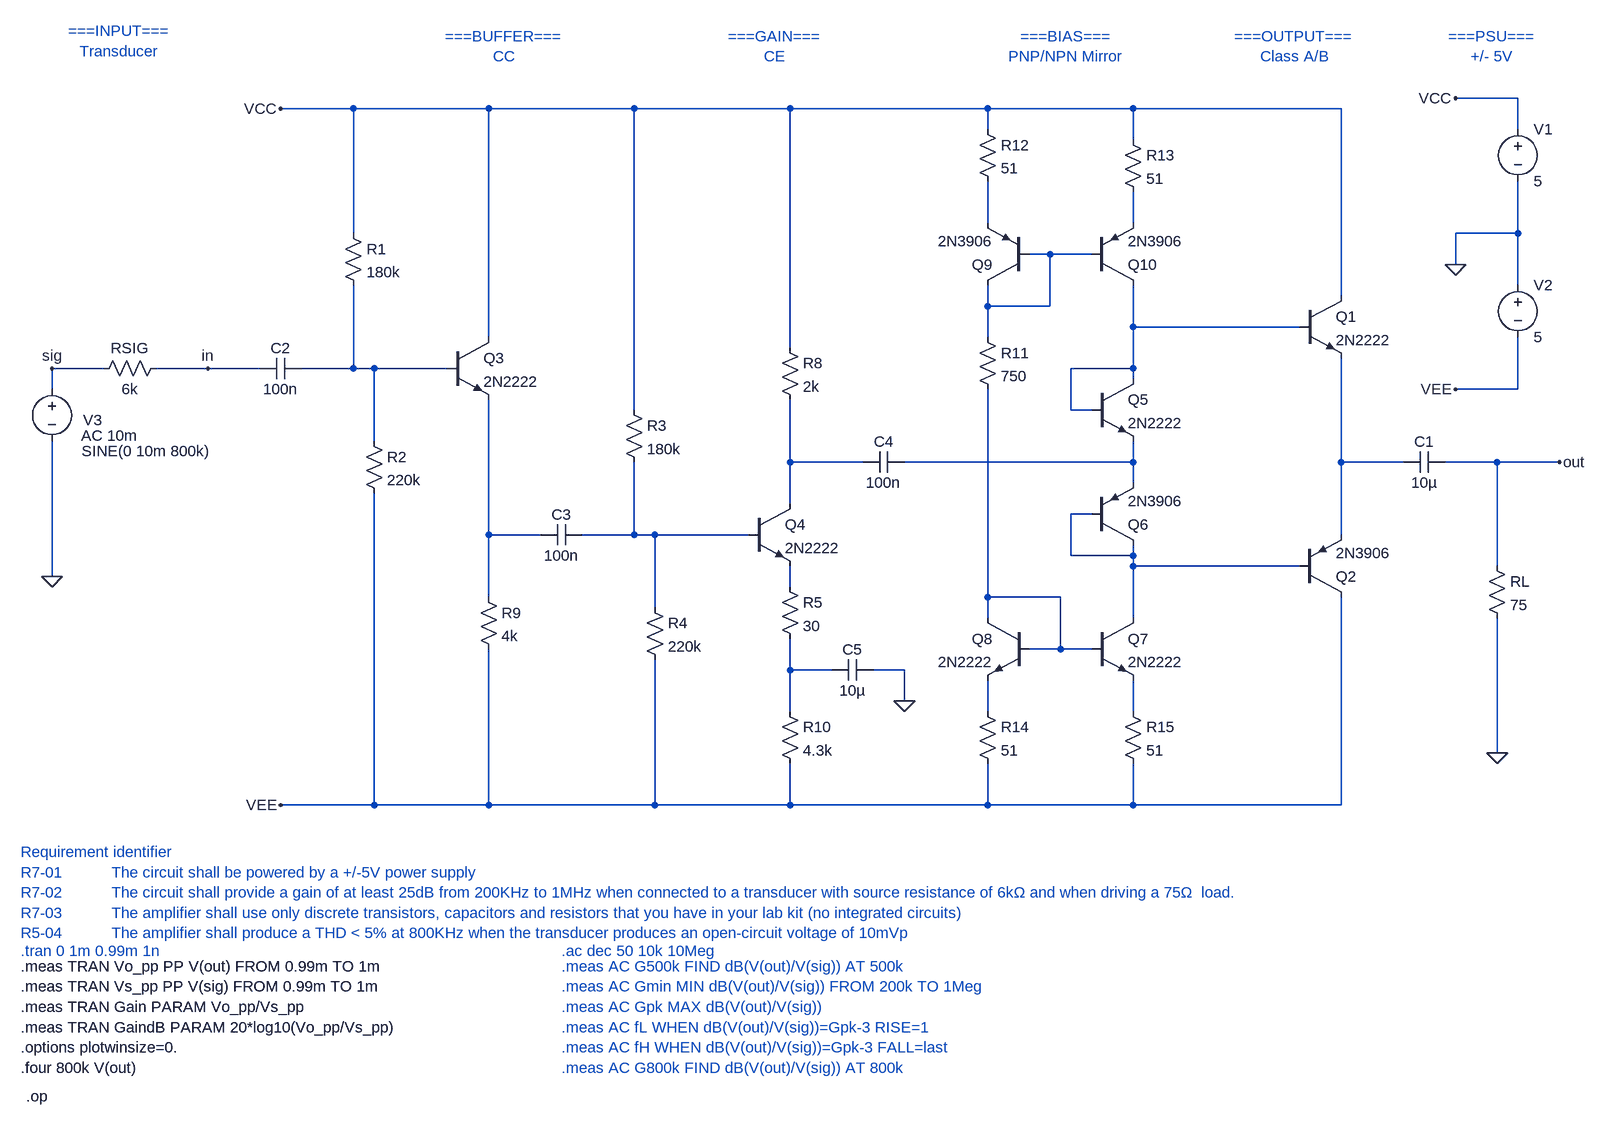
[diagram p0: schematic Lab 7 Amplifer V2.asc]
Lab 7 Amplifer V2.asc, the LTspice schematic file:
Version 4.1
SHEET 1 2900 1576
WIRE 2560 -752 2464 -752
WIRE 768 -736 656 -736
WIRE 976 -736 768 -736
WIRE 1200 -736 976 -736
WIRE 1440 -736 1200 -736
WIRE 1744 -736 1440 -736
WIRE 1968 -736 1744 -736
WIRE 2288 -736 1968 -736
WIRE 1744 -704 1744 -736
WIRE 2560 -704 2560 -752
WIRE 1968 -688 1968 -736
WIRE 1744 -560 1744 -624
WIRE 1968 -560 1968 -608
WIRE 768 -544 768 -736
WIRE 2560 -544 2560 -624
WIRE 2560 -544 2464 -544
WIRE 1840 -512 1808 -512
WIRE 1904 -512 1840 -512
WIRE 2464 -496 2464 -544
WIRE 2560 -464 2560 -544
WIRE 2288 -448 2288 -736
WIRE 1744 -432 1744 -464
WIRE 1840 -432 1840 -512
WIRE 1840 -432 1744 -432
WIRE 1968 -400 1968 -464
WIRE 2224 -400 1968 -400
WIRE 976 -384 976 -736
WIRE 1744 -384 1744 -432
WIRE 1440 -368 1440 -736
WIRE 384 -336 304 -336
WIRE 544 -336 464 -336
WIRE 624 -336 544 -336
WIRE 768 -336 768 -464
WIRE 768 -336 688 -336
WIRE 800 -336 768 -336
WIRE 912 -336 800 -336
WIRE 1968 -336 1968 -400
WIRE 1968 -336 1872 -336
WIRE 1968 -320 1968 -336
WIRE 304 -304 304 -336
WIRE 2560 -304 2560 -384
WIRE 2560 -304 2464 -304
WIRE 1200 -272 1200 -736
WIRE 1872 -272 1872 -336
WIRE 1904 -272 1872 -272
WIRE 800 -224 800 -336
WIRE 1440 -192 1440 -288
WIRE 1552 -192 1440 -192
WIRE 1968 -192 1968 -224
WIRE 1968 -192 1616 -192
WIRE 2288 -192 2288 -352
WIRE 2384 -192 2288 -192
WIRE 2528 -192 2448 -192
WIRE 2624 -192 2528 -192
WIRE 1968 -160 1968 -192
WIRE 1440 -128 1440 -192
WIRE 1904 -112 1872 -112
WIRE 976 -80 976 -288
WIRE 1056 -80 976 -80
WIRE 1200 -80 1200 -192
WIRE 1200 -80 1120 -80
WIRE 1232 -80 1200 -80
WIRE 1376 -80 1232 -80
WIRE 2288 -80 2288 -192
WIRE 1872 -48 1872 -112
WIRE 1968 -48 1968 -64
WIRE 1968 -48 1872 -48
WIRE 1968 -32 1968 -48
WIRE 2224 -32 1968 -32
WIRE 2528 -32 2528 -192
WIRE 304 -16 304 -224
WIRE 1440 0 1440 -32
WIRE 976 16 976 -80
WIRE 1744 16 1744 -304
WIRE 1856 16 1744 16
WIRE 1232 32 1232 -80
WIRE 1744 48 1744 16
WIRE 1968 48 1968 -32
WIRE 1856 96 1856 16
WIRE 1856 96 1808 96
WIRE 1904 96 1856 96
WIRE 1440 128 1440 80
WIRE 1504 128 1440 128
WIRE 1616 128 1568 128
WIRE 1616 176 1616 128
WIRE 1440 192 1440 128
WIRE 1744 192 1744 144
WIRE 1968 192 1968 144
WIRE 2528 256 2528 48
WIRE 800 336 800 -144
WIRE 800 336 656 336
WIRE 976 336 976 96
WIRE 976 336 800 336
WIRE 1232 336 1232 112
WIRE 1232 336 976 336
WIRE 1440 336 1440 272
WIRE 1440 336 1232 336
WIRE 1744 336 1744 272
WIRE 1744 336 1440 336
WIRE 1968 336 1968 272
WIRE 1968 336 1744 336
WIRE 2288 336 2288 16
WIRE 2288 336 1968 336
FLAG 2464 -496 0
FLAG 2464 -304 VEE
FLAG 2464 -752 VCC
FLAG 304 -16 0
FLAG 304 -336 sig
FLAG 544 -336 in
FLAG 2528 256 0
FLAG 2624 -192 out
FLAG 656 336 VEE
FLAG 656 -736 VCC
FLAG 1616 176 0
SYMBOL voltage 2560 -720 R0
WINDOW 123 0 0 Left 0
WINDOW 39 0 0 Left 0
SYMATTR InstName V1
SYMATTR Value 5
SYMBOL voltage 2560 -480 R0
WINDOW 123 0 0 Left 0
WINDOW 39 0 0 Left 0
SYMATTR InstName V2
SYMATTR Value 5
SYMBOL voltage 304 -320 R0
WINDOW 0 48 63 Left 2
WINDOW 3 46 111 Left 2
WINDOW 123 45 87 Left 2
WINDOW 39 0 0 Left 0
SYMATTR InstName V3
SYMATTR Value SINE(0 10m 800k)
SYMATTR Value2 AC 10m
SYMBOL res 480 -352 R90
WINDOW 0 0 56 VBottom 2
WINDOW 3 32 56 VTop 2
SYMATTR InstName RSIG
SYMATTR Value 6k
SYMBOL res 2512 -48 R0
SYMATTR InstName RL
SYMATTR Value 75
SYMBOL npn 2224 -448 R0
SYMATTR InstName Q1
SYMATTR Value 2N2222
SYMBOL pnp 2224 16 M180
SYMATTR InstName Q2
SYMATTR Value 2N3906
SYMBOL cap 2448 -208 R90
WINDOW 0 0 32 VBottom 2
WINDOW 3 32 32 VTop 2
SYMATTR InstName C1
SYMATTR Value 10µ
SYMBOL cap 688 -352 R90
WINDOW 0 0 32 VBottom 2
WINDOW 3 32 32 VTop 2
SYMATTR InstName C2
SYMATTR Value 100n
SYMBOL npn 912 -384 R0
SYMATTR InstName Q3
SYMATTR Value 2N2222
SYMBOL res 752 -560 R0
SYMATTR InstName R1
SYMATTR Value 180k
SYMBOL res 784 -240 R0
SYMATTR InstName R2
SYMATTR Value 220k
SYMBOL npn 1376 -128 R0
SYMATTR InstName Q4
SYMATTR Value 2N2222
SYMBOL cap 1120 -96 R90
WINDOW 0 0 32 VBottom 2
WINDOW 3 32 32 VTop 2
SYMATTR InstName C3
SYMATTR Value 100n
SYMBOL res 1184 -288 R0
SYMATTR InstName R3
SYMATTR Value 180k
SYMBOL res 1216 16 R0
SYMATTR InstName R4
SYMATTR Value 220k
SYMBOL cap 1616 -208 R90
WINDOW 0 0 32 VBottom 2
WINDOW 3 32 32 VTop 2
SYMATTR InstName C4
SYMATTR Value 100n
SYMBOL res 1424 -16 R0
SYMATTR InstName R5
SYMATTR Value 30
SYMBOL res 1424 -384 R0
SYMATTR InstName R8
SYMATTR Value 2k
SYMBOL res 960 0 R0
SYMATTR InstName R9
SYMATTR Value 4k
SYMBOL res 1424 176 R0
SYMATTR InstName R10
SYMATTR Value 4.3k
SYMBOL cap 1568 112 R90
WINDOW 0 0 32 VBottom 2
WINDOW 3 32 32 VTop 2
SYMATTR InstName C5
SYMATTR Value 10µ
SYMBOL npn 1904 -320 R0
SYMATTR InstName Q5
SYMATTR Value 2N2222
SYMBOL pnp 1904 -64 M180
SYMATTR InstName Q6
SYMATTR Value 2N3906
SYMBOL npn 1904 48 R0
SYMATTR InstName Q7
SYMATTR Value 2N2222
SYMBOL npn 1808 48 M0
SYMATTR InstName Q8
SYMATTR Value 2N2222
SYMBOL pnp 1808 -464 R180
SYMATTR InstName Q9
SYMATTR Value 2N3906
SYMBOL pnp 1904 -464 M180
SYMATTR InstName Q10
SYMATTR Value 2N3906
SYMBOL res 1728 -720 R0
SYMATTR InstName R12
SYMATTR Value 51
SYMBOL res 1952 -704 R0
SYMATTR InstName R13
SYMATTR Value 51
SYMBOL res 1728 176 R0
SYMATTR InstName R14
SYMATTR Value 51
SYMBOL res 1952 176 R0
SYMATTR InstName R15
SYMATTR Value 51
SYMBOL res 1728 -400 R0
SYMATTR InstName R11
SYMATTR Value 750
TEXT 256 408 Left 2 ;Requirement identifier\nR7-01           The circuit shall be powered by a +/-5V power supply\nR7-02           The circuit shall provide a gain of at least 25dB from 200KHz to 1MHz when connected to a transducer with source resistance of 6kΩ and when driving a 75Ω  load.\nR7-03           The amplifier shall use only discrete transistors, capacitors and resistors that you have in your lab kit (no integrated circuits)\nR5-04           The amplifier shall produce a THD < 5% at 800KHz when the transducer produces an open-circuit voltage of 10mVp
TEXT 256 560 Left 2 ;.tran 0 1m 0.99m 1n
TEXT 2216 -832 Center 2 ;===OUTPUT===\nClass A/B
TEXT 256 584 Left 2 !.meas TRAN Vo_pp PP V(out) FROM 0.99m TO 1m\n.meas TRAN Vs_pp PP V(sig) FROM 0.99m TO 1m\n.meas TRAN Gain PARAM Vo_pp/Vs_pp\n.meas TRAN GaindB PARAM 20*log10(Vo_pp/Vs_pp)\n.options plotwinsize=0.\n.four 800k V(out)
TEXT 1088 584 Left 2 ;.meas AC G500k FIND dB(V(out)/V(sig)) AT 500k\n.meas AC Gmin MIN dB(V(out)/V(sig)) FROM 200k TO 1Meg\n.meas AC Gpk MAX dB(V(out)/V(sig))\n.meas AC fL WHEN dB(V(out)/V(sig))=Gpk-3 RISE=1\n.meas AC fH WHEN dB(V(out)/V(sig))=Gpk-3 FALL=last\n.meas AC G800k FIND dB(V(out)/V(sig)) AT 800k
TEXT 1088 560 Left 2 ;.ac dec 50 10k 10Meg
TEXT 1864 -832 Center 2 ;===BIAS===\nPNP/NPN Mirror
TEXT 1416 -832 Center 2 ;===GAIN===\nCE
TEXT 1000 -832 Center 2 ;===BUFFER===\nCC
TEXT 408 -840 Center 2 ;===INPUT===\nTransducer
TEXT 2520 -832 Center 2 ;===PSU===\n+/- 5V
TEXT 264 784 Left 2 !.op

The netlist it stands for:
* Lab 7 Amplifer V2.asc
V1 VCC 0 5
V2 0 VEE 5
V3 sig 0 SINE(0 10m 800k) AC 10m
RSIG in sig 6k
RL out 0 75
Q1 VCC N004 N008 0 2N2222
Q2 VEE N009 N008 0 2N3906
C1 out N008 10µ
C2 N005 in 100n
Q3 VCC N005 N010 0 2N2222
R1 VCC N005 180k
R2 N005 VEE 220k
Q4 N006 N011 N012 0 2N2222
C3 N011 N010 100n
R3 VCC N011 180k
R4 N011 VEE 220k
C4 N007 N006 100n
R5 N012 N014 30
R8 VCC N006 2k
R9 N010 VEE 4k
R10 N014 VEE 4.3k
C5 0 N014 10µ
Q5 N004 N004 N007 0 2N2222
Q6 N009 N009 N007 0 2N3906
Q7 N009 N013 N016 0 2N2222
Q8 N013 N013 N015 0 2N2222
Q9 N003 N003 N001 0 2N3906
Q10 N004 N003 N002 0 2N3906
R12 VCC N001 51
R13 VCC N002 51
R14 N015 VEE 51
R15 N016 VEE 51
R11 N003 N013 750
.model NPN NPN
.model PNP PNP
.lib standard.bjt
* Requirement identifier
* R7-01           The circuit shall be powered by a +/-5V power supply
* R7-02           The circuit shall provide a gain of at least 25dB from 200KHz to 1MHz when connected to a transducer with source resistance of 6kΩ and when driving a 75Ω  load.
* R7-03           The amplifier shall use only discrete transistors, capacitors and resistors that you have in your lab kit (no integrated circuits)
* R5-04           The amplifier shall produce a THD < 5% at 800KHz when the transducer produces an open-circuit voltage of 10mVp
* .tran 0 1m 0.99m 1n
* ===OUTPUT===
* Class A/B
.meas TRAN Vo_pp PP V(out) FROM 0.99m TO 1m
.meas TRAN Vs_pp PP V(sig) FROM 0.99m TO 1m
.meas TRAN Gain PARAM Vo_pp/Vs_pp
.meas TRAN GaindB PARAM 20*log10(Vo_pp/Vs_pp)
.options plotwinsize=0.
.four 800k V(out)
* .meas AC G500k FIND dB(V(out)/V(sig)) AT 500k
* .meas AC Gmin MIN dB(V(out)/V(sig)) FROM 200k TO 1Meg
* .meas AC Gpk MAX dB(V(out)/V(sig))
* .meas AC fL WHEN dB(V(out)/V(sig))=Gpk-3 RISE=1
* .meas AC fH WHEN dB(V(out)/V(sig))=Gpk-3 FALL=last
* .meas AC G800k FIND dB(V(out)/V(sig)) AT 800k
* .ac dec 50 10k 10Meg
* ===BIAS===
* PNP/NPN Mirror
* ===GAIN===
* CE
* ===BUFFER===
* CC
* ===INPUT===
* Transducer
* ===PSU===
* +/- 5V
.op
.backanno
.end